# Altium schematic sheet ISO_signal.SchDoc
size A4
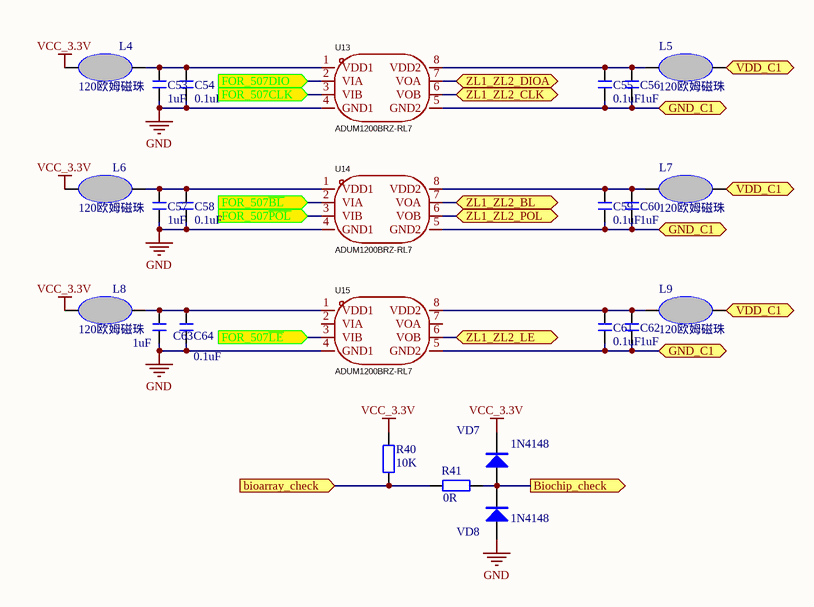
[diagram p0: ISO_signal.SchDoc]

## Parts
C53  1uF  [C 0603]
C54  0.1uF  [C 0603]
C55  0.1uF  [C 0603]
C56  1uF  [C 0603]
C57  1uF  [C 0603]
C58  0.1uF  [C 0603]
C59  0.1uF  [C 0603]
C60  1uF  [C 0603]
C61  0.1uF  [C 0603]
C62  1uF  [C 0603]
C63  1uF  [C 0603]
C64  0.1uF  [C 0603]
L4  120欧姆磁珠  [L 0603]
L5  120欧姆磁珠  [L 0603]
L6  120欧姆磁珠  [L 0603]
L7  120欧姆磁珠  [L 0603]
L8  120欧姆磁珠  [L 0603]
L9  120欧姆磁珠  [L 0603]
R40  10K  [R 0603]
R41  0R  [R 0603]
U13  ADUM1200BRZ-RL7  [SOIC-8_L4.9-W3.9-P1.27-LS6.0-BL]
U14  ADUM1200BRZ-RL7  [SOIC-8_L4.9-W3.9-P1.27-LS6.0-BL]
U15  ADUM1200BRZ-RL7  [SOIC-8_L4.9-W3.9-P1.27-LS6.0-BL]
VD7  1N4148  [SOD-323]
VD8  1N4148  [SOD-323]

## Ports
bioarray_check (in), Biochip_check (out), FOR_507CLK (in), FOR_507DIO (in), FOR_507~{BL} (in), FOR_507~{LE} (in), FOR_507~{POL} (in), GND_C1, VDD_C1, ZL1_ZL2_BL, ZL1_ZL2_CLK, ZL1_ZL2_DIOA, ZL1_ZL2_LE, ZL1_ZL2_POL

## Nets
GND: C53.2 C54.2 C57.2 C58.2 C63.2 C64.2 U13.4(GND1) U14.4(GND1) U15.4(GND1) VD8.1(A)
VCC_3.3V: L4.1 L6.1 L8.1 R40.1 VD7.2(K)
bioarray_check: R40.2 R41.2 ; port bioarray_check
Biochip_check: R41.1 VD7.1(A) VD8.2(K) ; port Biochip_check
FOR_507~{BL}: U14.2(VIA) ; port FOR_507~{BL}
FOR_507CLK: U13.3(VIB) ; port FOR_507CLK
FOR_507DIO: U13.2(VIA) ; port FOR_507DIO
FOR_507~{LE}: U15.3(VIB) ; port FOR_507~{LE}
FOR_507~{POL}: U14.3(VIB) ; port FOR_507~{POL}
GND_C1: C55.2 C56.2 C59.2 C60.2 C61.2 C62.2 U13.5(GND2) U14.5(GND2) U15.5(GND2) ; port GND_C1
VDD_C1: L5.2 L7.2 L9.2 ; port VDD_C1
ZL1_ZL2_BL: U14.7(VOA) ; port ZL1_ZL2_BL
ZL1_ZL2_CLK: U13.6(VOB) ; port ZL1_ZL2_CLK
ZL1_ZL2_DIOA: U13.7(VOA) ; port ZL1_ZL2_DIOA
ZL1_ZL2_LE: U15.6(VOB) ; port ZL1_ZL2_LE
ZL1_ZL2_POL: U14.6(VOB) ; port ZL1_ZL2_POL
NetC53_1: C53.1 C54.1 L4.2 U13.1(VDD1)
NetC55_1: C55.1 C56.1 L5.1 U13.8(VDD2)
NetC57_1: C57.1 C58.1 L6.2 U14.1(VDD1)
NetC59_1: C59.1 C60.1 L7.1 U14.8(VDD2)
NetC61_1: C61.1 C62.1 L9.1 U15.8(VDD2)
NetC63_1: C63.1 C64.1 L8.2 U15.1(VDD1)

Not connected (* = marked no-connect by the designer): U15 2(VIA) 7(VOA)

## Library data of the parts
C53-C64 = C-CC: 直插瓷片电容; 版权归属: 源创客; BOM名称: 直插瓷片电容; 学习资源: www.ooocke.com
L4-L9 = FERRITBEAD
R40 R41 = R: 贴片电阻; 版权归属: 源创客; BOM名称: 贴片电阻; 学习资源: www.ooocke.com
U13-U15 = ADUM1200BRZ-RL7: Add into BOM: yes; Number of Forward Channels: 2; Number of Reverse Channels: 0; Data Rate(Max): 25Mbps; Isolation Voltage(Vrms): 2500; CMTI(kV/us): 25kV/us; Symbol: ADUM1200BRZ; Device: ADUM1200BRZ-RL7; Supplier Part: C30230; Manufacturer Part: ADUM1200BRZ-RL7; Supplier Footprint: SOIC-8; JLCPCB Part Class: Extended Part; Datasheet: https://atta.szlcsc.com/upload/public/pdf/source/20140418/1457707045216.pdf; Supplier: LCSC; Convert to PCB: yes; Default Output: -; Rating: -; Comment_1: ADUM1200BRZ-RL7
VD7 VD8 = 1N4148: 高速开关二极管; 版权归属: 源创客; BOM名称: 高速开关二极管; 学习资源: www.ooocke.com